# Altium project Main_Board.PrjPcb (part 20 of 44)
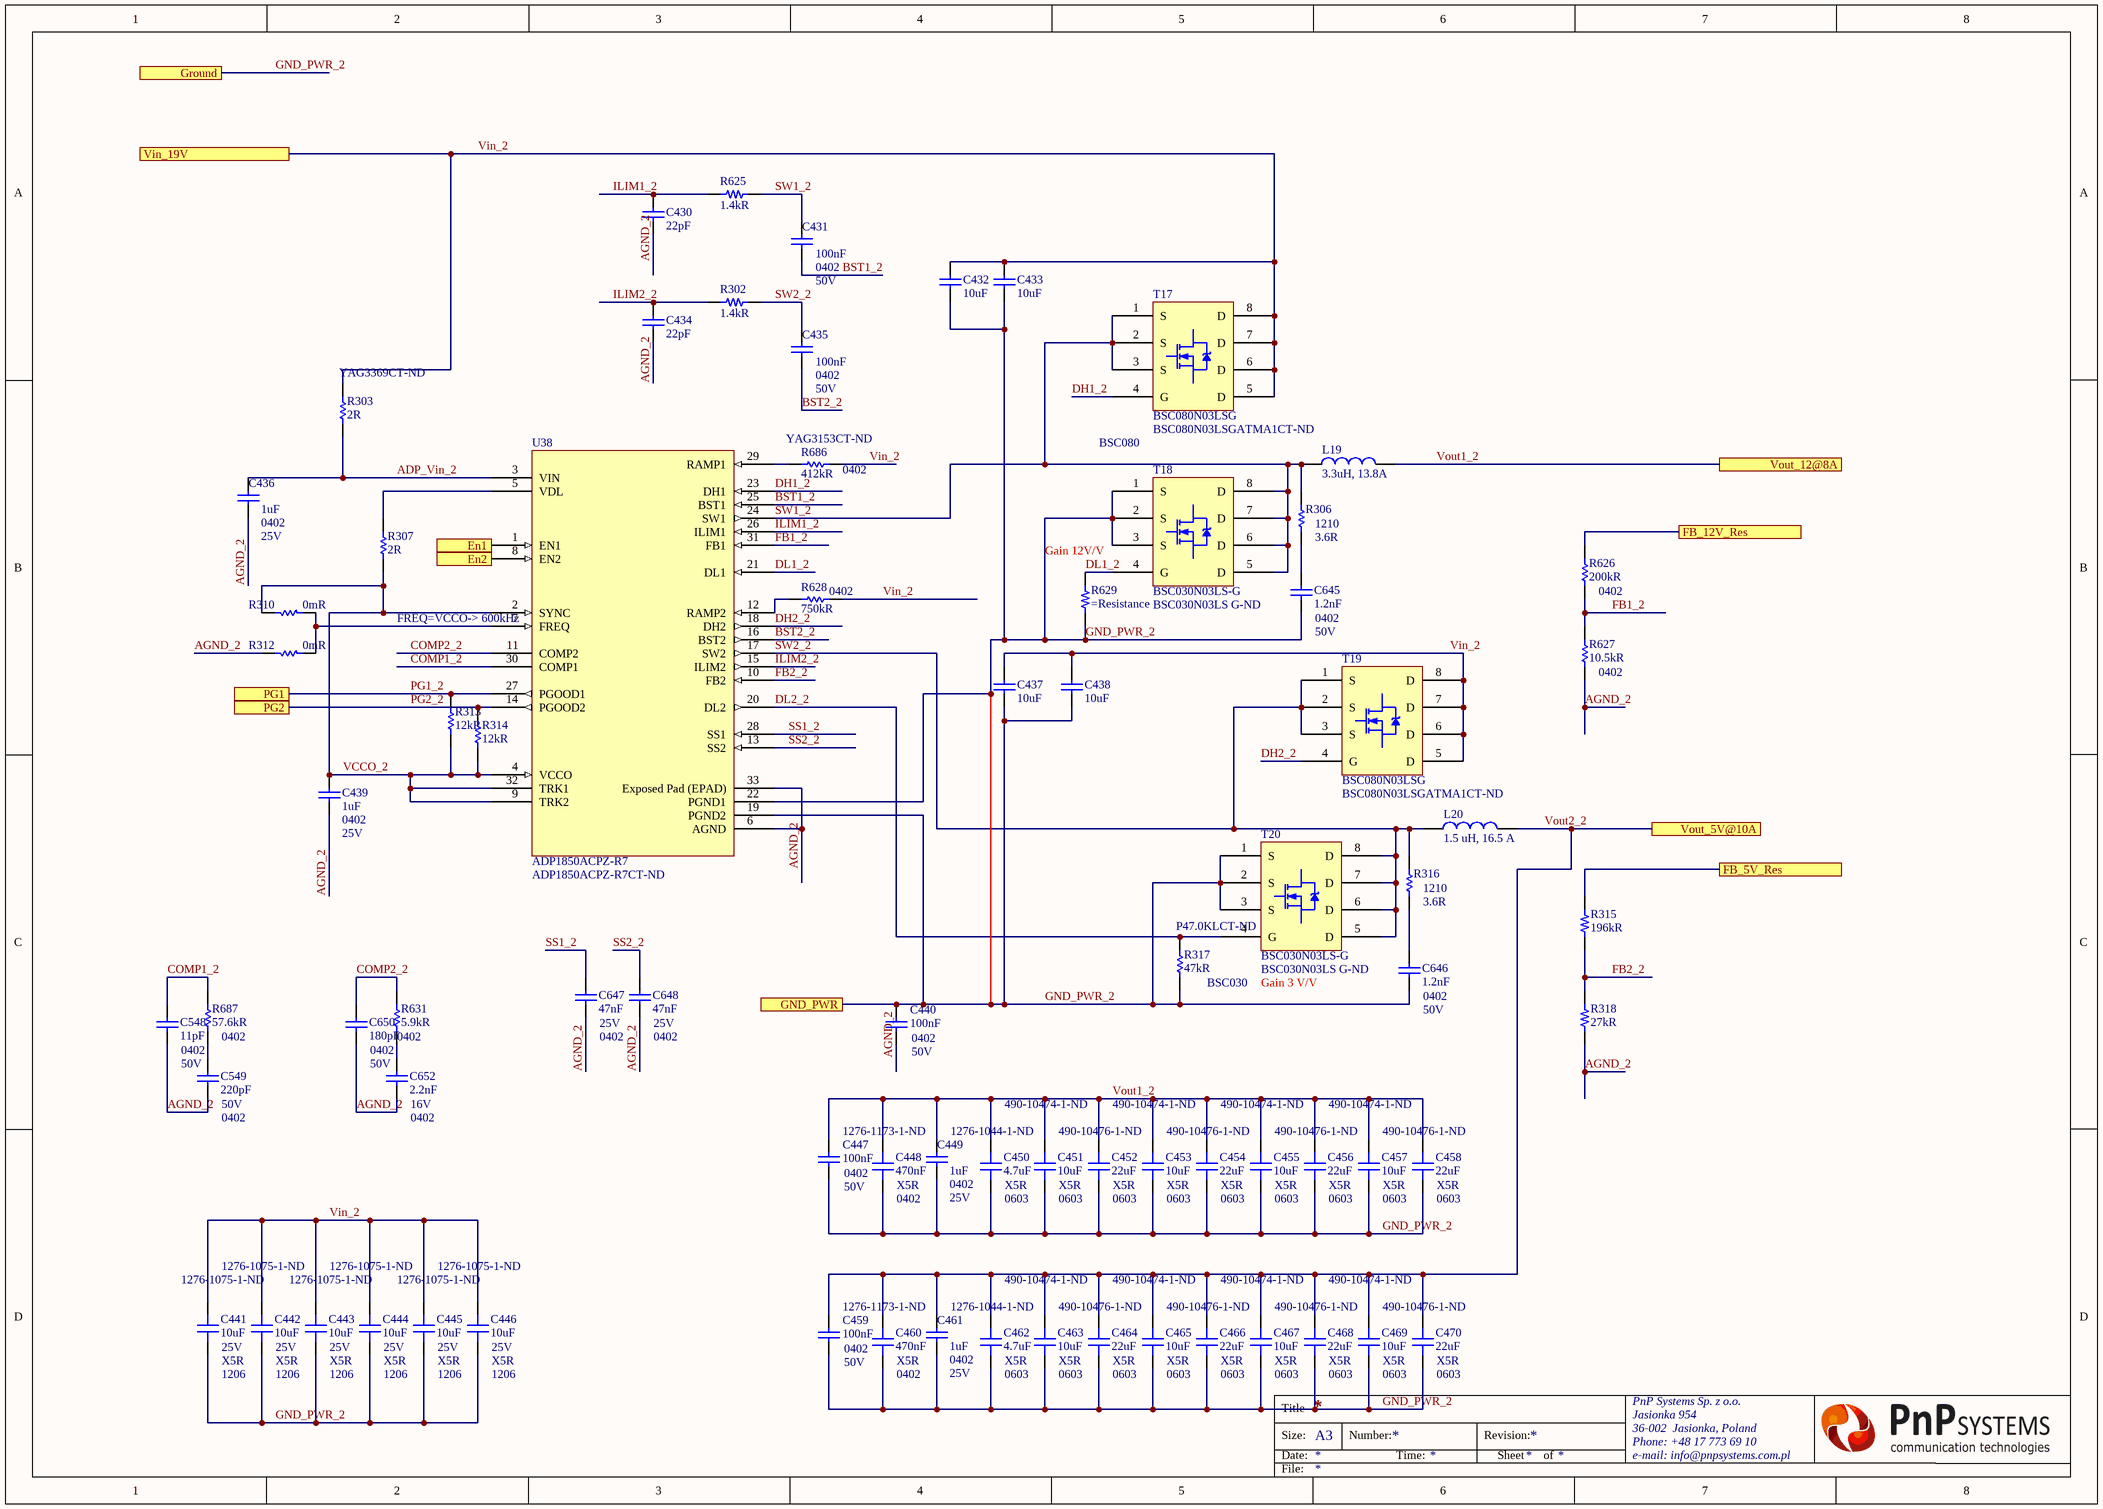
[diagram p131: Power_ADP1850_Dual_1.SchDoc]

## Sheet Power_ADP1850_Dual_1.SchDoc (continued)

### Library data of the parts (continued)
R687 = Resistor: Manufacturer: Panasonic; Manufacturer Part Number: ERA-2AEB5762X; Power Rating: 62.5mW; Tolerance: 0.1%; Temperature Coefficient: 25ppm/°C; Voltage Rating: 50V; Max Power Dissipation: 63mW; Supplier 1: Digi-Key; Supplier Part Number 1: P57.6KDCCT-ND; Stock 1: 25735; Pricing 1: 1 = 0,45000, 10 = 0,32100, 100 = 0,12830, 1000 = 0,06322, 2500 = 0,05858, 5000 = 0,05300 (USD); RoHS: Yes; Mount: Surface Mount; Case/Package: 0402; Case Code (Metric): 1005; Min Operating Temperature: -55°C; Max Operating Temperature: 155°C; Package Quantity: 1; Resistance: 57.6kR; Packaging: Tape and Reel; Composition: Thin Film; Number of Terminations: 2; Voltage Rating (DC): 50V; Features: Automotive AEC-Q200; Length: 0.039inch; Height: 0.016inch; Width: 0.02inch; REACH SVHC: Unknown; Lead Free: Lead Free; ComponentLink1URL: https://media.digikey.com/pdf/Data%20Sheets/Panasonic%20Resistors%20Thermistors%20PDFs/ERA_Series_LE.pdf?src-supplier=Digi-Key; ComponentLink1Description: https://media.digikey.com/pdf/Data%20Sheets/Panasonic%20Resistors%20Thermistors%20PDFs/ERA_Series_LE.pdf?src-supplier=Digi-Key; ComponentLink2URL: http://www.farnell.com/datasheets/2052875.pdf?src-supplier=Farnell; ComponentLink2Description: http://www.farnell.com/datasheets/2052875.pdf?src-supplier=Farnell; ComponentLink3URL: http://www.mouser.com/ds/2/315/AOA0000C237-1100991.pdf?src-supplier=Mouser; ComponentLink3Description: http://www.mouser.com/ds/2/315/AOA0000C237-1100991.pdf?src-supplier=Mouser; ComponentLink4URL: http://www.farnell.com/datasheets/2052875.pdf?src-supplier=Newark; ComponentLink4Description: http://www.farnell.com/datasheets/2052875.pdf?src-supplier=Newark; ComponentLink5URL: http://www.onlinecomponents.com/datasheet/era-2aeb5762x.aspx?p=44473802&src-supplier=Onlinecomponents.com; ComponentLink5Description: http://www.onlinecomponents.com/datasheet/era-2aeb5762x.aspx?p=44473802&src-supplier=Onlinecomponents.com; ComponentLink6URL: https://industrial.panasonic.com/cdbs/www-data/pdf/RDM0000/AOA0000C307.pdf?src-supplier=Digi-Key; ComponentLink6Description: https://industrial.panasonic.com/cdbs/www-data/pdf/RDM0000/AOA0000C307.pdf?src-supplier=Digi-Key; ComponentLink7URL: http://www.farnell.com/datasheets/1818319.pdf?src-supplier=Element14; ComponentLink7Description: http://www.farnell.com/datasheets/1818319.pdf?src-supplier=Element14
T17 T19 = BSC080N03LSG: as T5 on sheet HI_Curr_ADP1850; Supplier 1: Digi-Key; Manufacturer Part Number 1: BSC080N03LSG; Stock 1: 16105; Pricing 1: 1=0,70000, 10=0,61600, 100=0,42020, 500=0,35108, 1000=0,29878 (USD); RoHS: Yes; Number of Pins: 8; Min Operating Temperature: -55°C; Max Operating Temperature: 150°C; Packaging: Tape and Reel; Drain to Source Voltage (Vdss): 30V; Continuous Drain Current (ID): 53A; Package Quantity: 1; Drain to Source Breakdown Voltage: 30V; Drain to Source Resistance: 8mR; Length: 6.35mm; Height: 1.1mm; Width: 5.35mm; Halogen Free: Halogen Free; REACH SVHC: No SVHC; ComponentLink1URL: https://datasheet.ciiva.com/1189/infineon-bsc080n03ls-ds-v02-01-en-1189645.pdf?src-supplier=Element14; ComponentLink1Description: https://datasheet.ciiva.com/1189/infineon-bsc080n03ls-ds-v02-01-en-1189645.pdf?src-supplier=Element14; ComponentLink2URL: https://datasheet.ciiva.com/26789/bsc080n03ls-g-26789476.pdf?src-supplier=IIIC; ComponentLink2Description: https://datasheet.ciiva.com/26789/bsc080n03ls-g-26789476.pdf?src-supplier=IIIC
T18 T20 = BSC030N03LS-G: as T7 on sheet HI_Curr_ADP1850; RoHS: Yes; Case/Package: TO-252-3; Number of Pins: 8; Contact Plating: Tin; Min Operating Temperature: -55°C; Max Operating Temperature: 150°C; Packaging: Tape and Reel; Continuous Drain Current (ID): 100A; Package Quantity: 5000; Drain to Source Breakdown Voltage: 30V; Length: 5.35mm; Height: 1.1mm; Width: 6.35mm; Radiation Hardening: No; Halogen Free: Halogen Free; Lead Free: Lead Free; REACH SVHC: No SVHC; ComponentLink1URL: https://datasheet.ciiva.com/26896/getdatasheetpartid-635090-26896521.pdf?src-supplier=Verical; ComponentLink1Description: https://datasheet.ciiva.com/26896/getdatasheetpartid-635090-26896521.pdf?src-supplier=Verical; ComponentLink2URL: https://datasheet.ciiva.com/26790/bsc030n03ls-g-26790009.pdf?src-supplier=IIIC; ComponentLink2Description: https://datasheet.ciiva.com/26790/bsc030n03ls-g-26790009.pdf?src-supplier=IIIC; ComponentLink3URL: https://datasheet.ciiva.com/6368/bsc030n03ls-rev1-27-6368951.pdf?src-supplier=Digi-Key; ComponentLink3Description: https://datasheet.ciiva.com/6368/bsc030n03ls-rev1-27-6368951.pdf?src-supplier=Digi-Key; ComponentLink4URL: https://datasheet.ciiva.com/6368/bsc030n03ls-rev1-27-6368952.pdf?src-supplier=Digi-Key; ComponentLink4Description: https://datasheet.ciiva.com/6368/bsc030n03ls-rev1-27-6368952.pdf?src-supplier=Digi-Key; ComponentLink5URL: https://datasheet.ciiva.com/11172/bsc030n03ls-rev1-27-11172568.pdf?src-supplier=Avnet; ComponentLink5Description: https://datasheet.ciiva.com/11172/bsc030n03ls-rev1-27-11172568.pdf?src-supplier=Avnet; ComponentLink6URL: https://datasheet.ciiva.com/11172/bsc030n03ls-rev1-27-11172569.pdf?src-supplier=Avnet; ComponentLink6Description: https://datasheet.ciiva.com/11172/bsc030n03ls-rev1-27-11172569.pdf?src-supplier=Avnet; ComponentLink7URL: https://datasheet.ciiva.com/6368/bsc030n03ls-rev1-27-6368954.pdf?src-supplier=Digi-Key; ComponentLink7Description: https://datasheet.ciiva.com/6368/bsc030n03ls-rev1-27-6368954.pdf?src-supplier=Digi-Key; Supplier 1: Digi-Key; Manufacturer Part Number 1: BSC030N03LS-G; Stock 1: 0
U38 = ADP1850ACPZ-R7: as U34 on sheet HI_Curr_ADP1850; Supplier 1: Digi-Key; Manufacturer 1: Analog Devices; Manufacturer Part Number 1: ADP1850ACPZ-R7; Stock 1: 1022; Pricing 1: 1=4,61000, 10=4,14300, 25=3,91640, 100=3,39440, 250=3,22028, 500=2,88956 (USD); RoHS: Yes; Case/Package: LFCSP EP; Number of Pins: 32; Contact Plating: Tin,Matte; Min Operating Temperature: -40°C; Max Operating Temperature: 85°C; Packaging: Tape and Reel; Number of Output Phases: 2; Clock Sync: Yes; Max Input Voltage: 20V; Min Input Voltage: 2.75V; Radiation Hardening: No; REACH SVHC: No SVHC; Lead Free: Contains Lead; ComponentLink1URL: https://datasheet.ciiva.com/3217/adp1850-3217744.pdf?src-supplier=Avnet; ComponentLink1Description: https://datasheet.ciiva.com/3217/adp1850-3217744.pdf?src-supplier=Avnet; ComponentLink2URL: https://datasheet.ciiva.com/8306/adp1850-8306183.pdf?src-supplier=Avnet; ComponentLink2Description: https://datasheet.ciiva.com/8306/adp1850-8306183.pdf?src-supplier=Avnet; ComponentLink3URL: https://datasheet.ciiva.com/2015/adp1850-2015067.pdf?src-supplier=Digi-Key; ComponentLink3Description: https://datasheet.ciiva.com/2015/adp1850-2015067.pdf?src-supplier=Digi-Key; ComponentLink4URL: https://datasheet.ciiva.com/17297/adp1850-17297115.pdf?src-supplier=Avnet+Europe; ComponentLink4Description: https://datasheet.ciiva.com/17297/adp1850-17297115.pdf?src-supplier=Avnet+Europe; ComponentLink5URL: https://datasheet.ciiva.com/2015/adp1850-2015068.pdf?src-supplier=Digi-Key; ComponentLink5Description: https://datasheet.ciiva.com/2015/adp1850-2015068.pdf?src-supplier=Digi-Key; ComponentLink6URL: https://datasheet.ciiva.com/2015/adp1850-2015069.pdf?src-supplier=Digi-Key; ComponentLink6Description: https://datasheet.ciiva.com/2015/adp1850-2015069.pdf?src-supplier=Digi-Key

## Sheet Pomiar_napiecia_high_curr.SchDoc
size A4
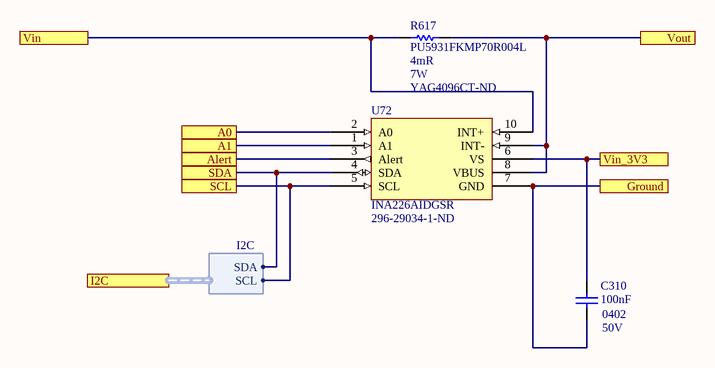
[diagram p26: Pomiar_napiecia_high_curr.SchDoc]

### Parts
C310  100nF  Case Code (Imperial): 0402  Voltage: 50V  [CAP 0402/1005 KK]
R617  PU5931FKMP70R004L  Resistance: 4mR  Max Power Dissipation: 7W  Supplier Part Number 1: YAG4096CT-ND  [PU5931]
U72  INA226AIDGSR  Supplier Part Number 1: 296-29034-1-ND  [INA226]

### Ports
A0, A1, Alert, Ground, I2C (harness I2C), SCL, SDA, Vin, Vin_3V3, Vout

### Harnesses
I2C: SCL, SDA

### Nets
B503_Ground: C310.1 U72.7(GND) ; port Ground
0.85V@40A_INA: R617.1 U72.10(INT+) ; port Vin
3V3_RAIL: C310.2 U72.6(VS) ; port Vin_3V3
SFP_I2C5.SCL: U72.5(SCL) ; port SCL, port I2C.SCL
SFP_I2C5.SDA: U72.4(SDA) ; port SDA, port I2C.SDA
US+_Vcc_PS_IntFp: R617.2 U72.8(VBUS) U72.9(INT-) ; port Vout
NetR14_1: U72.2(A0) ; port A0
NetR304_1: U72.1(A1) ; port A1
NetR866_2: U72.3(Alert) ; port Alert

### Library data of the parts
C310 = Capacitor: as C346 on sheet HI_Curr_ADP1850; Supplier 1: Digi-Key; Supplier Part Number 1: 490-10697-1-ND; RoHS: Yes; Category: Ceramic Capacitors; Stock 1: 435607; Pricing 1: 1=0,10000, 10=0,04600, 100=0,02050, 500=0,01464, 1000=0,01150, 2500=0,01045, 5000=0,00961 (USD); Mount: Surface Mount; Case/Package: 0402; Weight: 0.000212oz; Case Code (Metric): 1005; Min Operating Temperature: -55°C; Max Operating Temperature: 85°C; Capacitance: 100nF; Packaging: Tape and Reel; Voltage Rating: 50V; Dielectric: X5R; Termination: SMD/SMT; Composition: Ceramic; Voltage Rating (DC): 50V; Package Quantity: 10000; Length: 1mm; Height: 0.5mm; Width: 0.02inch; Thickness: 0.022inch; Depth: 0.5mm; REACH SVHC: No SVHC; Lead Free: Lead Free; ComponentLink1URL: http://www.farnell.com/datasheets/2079150.pdf?src-supplier=Farnell; ComponentLink1Description: http://www.farnell.com/datasheets/2079150.pdf?src-supplier=Farnell; ComponentLink2URL: http://www.mouser.com/ds/2/281/c02e-2905.pdf?src-supplier=Mouser; ComponentLink2Description: http://www.mouser.com/ds/2/281/c02e-2905.pdf?src-supplier=Mouser; ComponentLink3URL: http://www.farnell.com/datasheets/2079150.pdf?src-supplier=Element14; ComponentLink3Description: http://www.farnell.com/datasheets/2079150.pdf?src-supplier=Element14; ComponentLink4URL: http://search.murata.co.jp/Ceramy/image/img/A01X/G101/ENG/GRM155R61H104KE14-01.pdf?src-supplier=Digi-Key; ComponentLink4Description: http://search.murata.co.jp/Ceramy/image/img/A01X/G101/ENG/GRM155R61H104KE14-01.pdf?src-supplier=Digi-Key
R617 = PU5931FKMP70R004L: RES 0.004 OHM 1% 7W 5931; Manufacturer: Yageo; Temperature Coefficient: 75ppm/°C; Supplier 1: Digi-Key; Manufacturer Part Number: PU5931FKMP70R004L; RoHS: Yes; Category: Chip SMD Resistors; Stock 1: 1315; Pricing 1: 1=2,01000, 10=1,78200, 25=1,65280, 50=1,55540, 100=1,36110, 250=1,16660, 500=0,97218 (USD); Case/Package: 5931; Min Operating Temperature: -65°C; Max Operating Temperature: 170°C; Tolerance: 1%; Packaging: Cut Tape; Composition: Metal Element; Features: Moisture Resistant,Automotive AEC-Q200; Number of Terminations: 2; Length: 0.591inch; Height: 0.015inch; Width: 0.305inch; ComponentLink1URL: http://www.yageo.com/documents/recent/PYu-PU_51_RoHS_L_6.pdf?src-supplier=Digi-Key; ComponentLink1Description: http://www.yageo.com/documents/recent/PYu-PU_51_RoHS_L_6.pdf?src-supplier=Digi-Key; ComponentLink2URL: http://www.yageo.com/documents/recent/PYu-PU_51_RoHS_L_3.pdf?src-supplier=Digi-Key; ComponentLink2Description: http://www.yageo.com/documents/recent/PYu-PU_51_RoHS_L_3.pdf?src-supplier=Digi-Key
U72 = INA226AIDGSR: IC MONITOR PWR/CURR BIDIR 10MSOP; Manufacturer: Texas Instruments; Min Supply Voltage: 2.7V; Max Supply Voltage: 5.5V; Nominal Supply Current: 330uA; Common Mode Rejection Ratio: 140dB; Output Current: 10mA; Input Bias Current: 10uA; Input Offset Voltage (Vos): 2.5uV; Accuracy: 0.02%; Supplier 1: Digi-Key; Manufacturer Part Number: INA226AIDGSR; Stock 1: 62024; Pricing 1: 1 = 2,88000, 10 = 2,58900, 100 = 2,12100, 500 = 1,80554, 1000 = 1,52275 (USD); RoHS: Yes; Mount: Surface Mount; Case/Package: VSSOP; Number of Pins: 10; Contact Plating: Gold; Min Operating Temperature: -40°C; Max Operating Temperature: 125°C; Packaging: Tape and Reel; Package Quantity: 1; Radiation Hardening: No; REACH SVHC: No SVHC; Lead Free: Lead Free; ComponentLink1URL: https://datasheet.ciiva.com/1939/ina226-1939633.pdf?src-supplier=Digi-Key; ComponentLink1Description: https://datasheet.ciiva.com/1939/ina226-1939633.pdf?src-supplier=Digi-Key; ComponentLink2URL: https://datasheet.ciiva.com/4875/sbos547-126280-4875559.pdf?src-supplier=Mouser; ComponentLink2Description: https://datasheet.ciiva.com/4875/sbos547-126280-4875559.pdf?src-supplier=Mouser; ComponentLink3URL: https://datasheet.ciiva.com/1939/ina226-1939634.pdf?src-supplier=Digi-Key; ComponentLink3Description: https://datasheet.ciiva.com/1939/ina226-1939634.pdf?src-supplier=Digi-Key; ComponentLink4URL: https://datasheet.ciiva.com/1939/ina226-1939635.pdf?src-supplier=Digi-Key; ComponentLink4Description: https://datasheet.ciiva.com/1939/ina226-1939635.pdf?src-supplier=Digi-Key; ComponentLink5URL: https://datasheet.ciiva.com/14196/ina226-14196741.pdf?src-supplier=Avnet; ComponentLink5Description: https://datasheet.ciiva.com/14196/ina226-14196741.pdf?src-supplier=Avnet; ComponentLink6URL: https://datasheet.ciiva.com/22693/1840205-22693516.pdf?src-supplier=Element14; ComponentLink6Description: https://datasheet.ciiva.com/22693/1840205-22693516.pdf?src-supplier=Element14